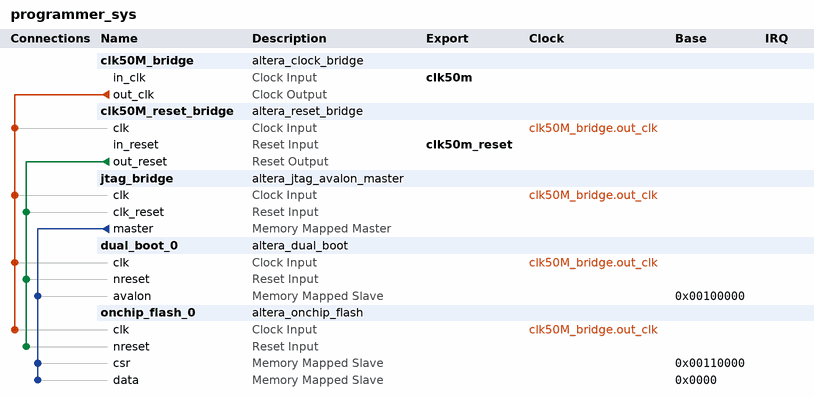
[diagram p0: system contents]
# Platform Designer (Qsys) system programmer_sys, MAX 10 10M16SAU324I7G
# Parameters at their usual value, and those the tool derives, are not listed.
package require -exact qsys 19.1
create_system programmer_sys
set_project_property DEVICE_FAMILY {MAX 10}
set_project_property DEVICE 10M16SAU324I7G

add_instance clk50M_bridge altera_clock_bridge 19.1
set_instance_parameter_value clk50M_bridge DERIVED_CLOCK_RATE 0
set_instance_parameter_value clk50M_bridge EXPLICIT_CLOCK_RATE 50000000

add_instance clk50M_reset_bridge altera_reset_bridge 19.1
set_instance_parameter_value clk50M_reset_bridge ACTIVE_LOW_RESET 1
set_instance_parameter_value clk50M_reset_bridge SYNCHRONOUS_EDGES deassert

add_instance jtag_bridge altera_jtag_avalon_master 19.1

add_instance dual_boot_0 altera_dual_boot 19.1
set_instance_parameter_value dual_boot_0 CLOCK_FREQUENCY 50.0

add_instance onchip_flash_0 altera_onchip_flash 19.1
set_instance_parameter_value onchip_flash_0 CLOCK_FREQUENCY 50.0
set_instance_parameter_value onchip_flash_0 CONFIGURATION_MODE {Dual Compressed Images}
set_instance_parameter_value onchip_flash_0 SECTOR_ACCESS_MODE {Read and write,Read and write,Read and write,Read and write,Read and write}
set_instance_parameter_value onchip_flash_0 initFlashContent false
set_instance_parameter_value onchip_flash_0 initializationFileName altera_onchip_flash.hex
set_instance_parameter_value onchip_flash_0 useNonDefaultInitFile false

# connections
add_connection clk50M_bridge.out_clk clk50M_reset_bridge.clk clock
add_connection clk50M_bridge.out_clk dual_boot_0.clk clock
add_connection clk50M_bridge.out_clk jtag_bridge.clk clock
add_connection clk50M_bridge.out_clk onchip_flash_0.clk clock
add_connection clk50M_reset_bridge.out_reset dual_boot_0.nreset reset
add_connection clk50M_reset_bridge.out_reset jtag_bridge.clk_reset reset
add_connection clk50M_reset_bridge.out_reset onchip_flash_0.nreset reset
add_connection jtag_bridge.master dual_boot_0.avalon avalon
set_connection_parameter_value jtag_bridge.master/dual_boot_0.avalon baseAddress 0x00100000
add_connection jtag_bridge.master onchip_flash_0.csr avalon
set_connection_parameter_value jtag_bridge.master/onchip_flash_0.csr baseAddress 0x00110000
add_connection jtag_bridge.master onchip_flash_0.data avalon
set_connection_parameter_value jtag_bridge.master/onchip_flash_0.data baseAddress 0x0000

# exported interfaces
add_interface clk50m clock sink
set_interface_property clk50m EXPORT_OF clk50M_bridge.in_clk
add_interface clk50m_reset reset sink
set_interface_property clk50m_reset EXPORT_OF clk50M_reset_bridge.in_reset

set_interconnect_requirement {$system} qsys_mm.clockCrossingAdapter HANDSHAKE
set_interconnect_requirement {$system} qsys_mm.enableEccProtection FALSE
set_interconnect_requirement {$system} qsys_mm.insertDefaultSlave FALSE
set_interconnect_requirement {$system} qsys_mm.maxAdditionalLatency 1

save_system programmer_sys.qsys
